# Vivado block design system, xc7z010clg400-1, Vivado 2021.2
# (continued, part 2 of 3)
current_bd_instance /system

# ---- hierarchy /write_to_ram ----
current_bd_instance /write_to_ram
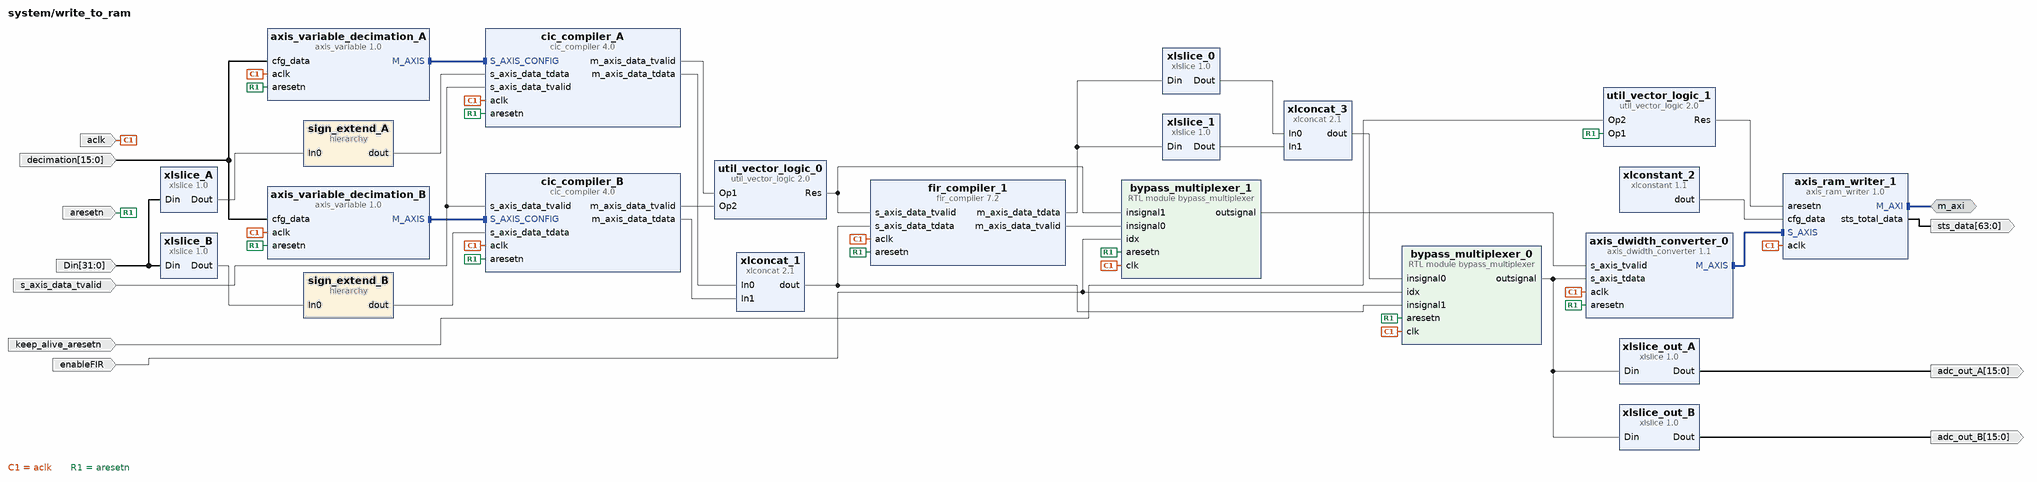
[diagram p12: block diagram inside /write_to_ram]
create_bd_intf_pin -mode Master -vlnv xilinx.com:interface:aximm_rtl:1.0 m_axi
create_bd_pin -dir I -from 31 -to 0 Din
create_bd_pin -dir I -type clk aclk
create_bd_pin -dir O -from 15 -to 0 adc_out_A
create_bd_pin -dir O -from 15 -to 0 adc_out_B
create_bd_pin -dir I -type rst aresetn
create_bd_pin -dir I -from 15 -to 0 decimation
create_bd_pin -dir I enableFIR
create_bd_pin -dir I -type rst keep_alive_aresetn
create_bd_pin -dir I s_axis_data_tvalid
create_bd_pin -dir O -from 63 -to 0 sts_data

create_bd_cell -type ip -vlnv xilinx.com:ip:axis_dwidth_converter:1.1 axis_dwidth_converter_0
set_property -dict {CONFIG.M_TDATA_NUM_BYTES 8 CONFIG.S_TDATA_NUM_BYTES 4} [get_bd_cells axis_dwidth_converter_0]
create_bd_cell -type ip -vlnv pavel-demin:user:axis_ram_writer:1.0 axis_ram_writer_1
set_property -dict {CONFIG.ADDR_WIDTH 24} [get_bd_cells axis_ram_writer_1]
create_bd_cell -type ip -vlnv pavel-demin:user:axis_variable:1.0 axis_variable_decimation_A
set_property -dict {CONFIG.AXIS_TDATA_WIDTH 16} [get_bd_cells axis_variable_decimation_A]
create_bd_cell -type ip -vlnv pavel-demin:user:axis_variable:1.0 axis_variable_decimation_B
set_property -dict {CONFIG.AXIS_TDATA_WIDTH 16} [get_bd_cells axis_variable_decimation_B]
create_bd_cell -type module -reference bypass_multiplexer bypass_multiplexer_0
set_property -dict {CONFIG.DATA_WIDTH 32} [get_bd_cells bypass_multiplexer_0]
create_bd_cell -type module -reference bypass_multiplexer bypass_multiplexer_1
set_property -dict {CONFIG.DATA_WIDTH 1} [get_bd_cells bypass_multiplexer_1]
create_bd_cell -type ip -vlnv xilinx.com:ip:cic_compiler:4.0 cic_compiler_A
set_property -dict [list \
  CONFIG.Clock_Frequency 125 \
  CONFIG.Filter_Type Decimation \
  CONFIG.Fixed_Or_Initial_Rate 8 \
  CONFIG.HAS_ARESETN true \
  CONFIG.Input_Data_Width 14 \
  CONFIG.Input_Sample_Frequency 125 \
  CONFIG.Maximum_Rate 8192 \
  CONFIG.Minimum_Rate 4 \
  CONFIG.Number_Of_Stages 6 \
  CONFIG.Output_Data_Width 16 \
  CONFIG.Quantization Truncation \
  CONFIG.SamplePeriod 1 \
  CONFIG.Sample_Rate_Changes Programmable \
] [get_bd_cells cic_compiler_A]
create_bd_cell -type ip -vlnv xilinx.com:ip:cic_compiler:4.0 cic_compiler_B
set_property -dict [list \
  CONFIG.Clock_Frequency 125 \
  CONFIG.Filter_Type Decimation \
  CONFIG.Fixed_Or_Initial_Rate 8 \
  CONFIG.HAS_ARESETN true \
  CONFIG.Input_Data_Width 14 \
  CONFIG.Input_Sample_Frequency 125 \
  CONFIG.Maximum_Rate 8192 \
  CONFIG.Minimum_Rate 4 \
  CONFIG.Number_Of_Stages 6 \
  CONFIG.Output_Data_Width 16 \
  CONFIG.Quantization Truncation \
  CONFIG.SamplePeriod 1 \
  CONFIG.Sample_Rate_Changes Programmable \
  CONFIG.Use_Xtreme_DSP_Slice true \
] [get_bd_cells cic_compiler_B]
create_bd_cell -type ip -vlnv xilinx.com:ip:fir_compiler:7.2 fir_compiler_1
set_property -dict [list \
  CONFIG.BestPrecision true \
  CONFIG.Clock_Frequency 125 \
  CONFIG.CoefficientVector {9.925103405823654e-6, -4.174363282738153e-5, -5.51901793488376e-5, 7.368959088121815e-5, 0.00015990473687184194, -6.76620396082366e-5, -0.0003346964692496276, -3.9313022473348724e-5, 0.0005560562181887152, 0.0003225578127550501, -0.0007467674417401369, -0.0008420592613214142, 0.0007671235211513573, 0.0016018044027042001, -0.00042717093620696226, -0.0025052594870282234, -0.00047306360426935745, 0.0033218592560732216, 0.002075564973101382, -0.003681857378456846, -0.004378381518006709, 0.0031142208631228657, 0.007150965272845437, -0.0011339320674475808, -0.009875779306823484, -0.0026274562840349655, 0.01174025558643619, 0.008267468617760211, -0.011694071059013518, -0.015463246390667961, 0.008569880890248936, 0.02335524917895585, -0.0012434662137906153, -0.030475702526067405, -0.011215696029381172, 0.03468814181782342, 0.029481462816320546, -0.03299020455574372, -0.05412187304631057, 0.020670791935294395, 0.08620564090140646, 0.012279627206068015, -0.12872548525128363, -0.10014341802122498, 0.18180203856402496, 0.4770892664568863, 0.47708926645688643, 0.18180203856402533, -0.10014341802122484, -0.12872548525128372, 0.012279627206067881, 0.08620564090140649, 0.02067079193529451, -0.05412187304631054, -0.0329902045557438, 0.029481462816320483, 0.03468814181782345, -0.01121569602938112, -0.030475702526067405, -0.0012434662137906513, 0.02335524917895585, 0.008569880890248972, -0.01546324639066795, -0.01169407105901354, 0.008267468617760182, 0.01174025558643619, -0.002627456284034945, -0.009875779306823478, -0.0011339320674475855, 0.007150965272845437, 0.0031142208631228757, -0.004378381518006705, -0.003681857378456855, 0.0020755649731013692, 0.003321859256073219, -0.0004730636042693505, -0.002505259487028216, -0.00042717093620696166, 0.0016018044027042, 0.0007671235211513586, -0.0008420592613214133, -0.0007467674417401388, 0.00032255781275504627, 0.0005560562181887131, -3.931302247334831e-5, -0.000334696469249626, -6.76620396082356e-5, 0.00015990473687184224, 7.368959088121812e-5, -5.519017934883768e-5, -4.174363282738155e-5, 9.925103405823647e-6} \
  CONFIG.Coefficient_Fractional_Bits 24 \
  CONFIG.Coefficient_Sets 1 \
  CONFIG.Coefficient_Sign Signed \
  CONFIG.Coefficient_Structure Symmetric \
  CONFIG.Coefficient_Width 24 \
  CONFIG.ColumnConfig 6 \
  CONFIG.Data_Fractional_Bits 0 \
  CONFIG.Data_Width 16 \
  CONFIG.Decimation_Rate 2 \
  CONFIG.Filter_Architecture Systolic_Multiply_Accumulate \
  CONFIG.Filter_Type Decimation \
  CONFIG.Has_ARESETn true \
  CONFIG.Interpolation_Rate 1 \
  CONFIG.Number_Channels 1 \
  CONFIG.Number_Paths 2 \
  CONFIG.Output_Rounding_Mode Convergent_Rounding_to_Even \
  CONFIG.Output_Width 18 \
  CONFIG.Quantization Quantize_Only \
  CONFIG.RateSpecification Frequency_Specification \
  CONFIG.Rate_Change_Type Integer \
  CONFIG.SamplePeriod 1 \
  CONFIG.Sample_Frequency 31.25 \
  CONFIG.Zero_Pack_Factor 1 \
] [get_bd_cells fir_compiler_1]
create_bd_cell -type hier sign_extend_A
create_bd_cell -type hier sign_extend_B
create_bd_cell -type ip -vlnv xilinx.com:ip:util_vector_logic:2.0 util_vector_logic_0
set_property -dict {CONFIG.C_OPERATION or CONFIG.C_SIZE 1} [get_bd_cells util_vector_logic_0]
create_bd_cell -type ip -vlnv xilinx.com:ip:util_vector_logic:2.0 util_vector_logic_1
set_property -dict {CONFIG.C_OPERATION or} [get_bd_cells util_vector_logic_1]
create_bd_cell -type ip -vlnv xilinx.com:ip:xlconcat:2.1 xlconcat_1
create_bd_cell -type ip -vlnv xilinx.com:ip:xlconcat:2.1 xlconcat_3
create_bd_cell -type ip -vlnv xilinx.com:ip:xlconstant:1.1 xlconstant_2
set_property -dict {CONFIG.CONST_VAL 402653184 CONFIG.CONST_WIDTH 32} [get_bd_cells xlconstant_2]
create_bd_cell -type ip -vlnv xilinx.com:ip:xlslice:1.0 xlslice_0
set_property -dict {CONFIG.DIN_FROM 15 CONFIG.DIN_WIDTH 48 CONFIG.DOUT_WIDTH 16} [get_bd_cells xlslice_0]
create_bd_cell -type ip -vlnv xilinx.com:ip:xlslice:1.0 xlslice_1
set_property -dict {CONFIG.DIN_FROM 39 CONFIG.DIN_TO 24 CONFIG.DIN_WIDTH 48 CONFIG.DOUT_WIDTH 16} [get_bd_cells xlslice_1]
create_bd_cell -type ip -vlnv xilinx.com:ip:xlslice:1.0 xlslice_A
set_property -dict {CONFIG.DIN_FROM 13 CONFIG.DOUT_WIDTH 14} [get_bd_cells xlslice_A]
create_bd_cell -type ip -vlnv xilinx.com:ip:xlslice:1.0 xlslice_B
set_property -dict {CONFIG.DIN_FROM 29 CONFIG.DIN_TO 16 CONFIG.DOUT_WIDTH 14} [get_bd_cells xlslice_B]
create_bd_cell -type ip -vlnv xilinx.com:ip:xlslice:1.0 xlslice_out_A
set_property -dict {CONFIG.DIN_FROM 15 CONFIG.DOUT_WIDTH 16} [get_bd_cells xlslice_out_A]
create_bd_cell -type ip -vlnv xilinx.com:ip:xlslice:1.0 xlslice_out_B
set_property -dict {CONFIG.DIN_FROM 31 CONFIG.DIN_TO 16 CONFIG.DOUT_WIDTH 16} [get_bd_cells xlslice_out_B]

# ---- hierarchy /write_to_ram/sign_extend_A ----
current_bd_instance /write_to_ram/sign_extend_A
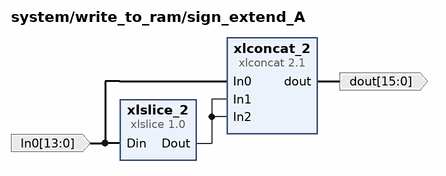
[diagram p13: block diagram inside /write_to_ram/sign_extend_A]
create_bd_pin -dir I -from 13 -to 0 In0
create_bd_pin -dir O -from 15 -to 0 dout

create_bd_cell -type ip -vlnv xilinx.com:ip:xlconcat:2.1 xlconcat_2
set_property -dict {CONFIG.IN0_WIDTH 14 CONFIG.IN1_WIDTH 1 CONFIG.IN2_WIDTH 1 CONFIG.NUM_PORTS 3} [get_bd_cells xlconcat_2]
create_bd_cell -type ip -vlnv xilinx.com:ip:xlslice:1.0 xlslice_2
set_property -dict {CONFIG.DIN_FROM 13 CONFIG.DIN_TO 13 CONFIG.DIN_WIDTH 14 CONFIG.DOUT_WIDTH 1} [get_bd_cells xlslice_2]

# ---- hierarchy /write_to_ram/sign_extend_B ----
current_bd_instance /write_to_ram/sign_extend_B
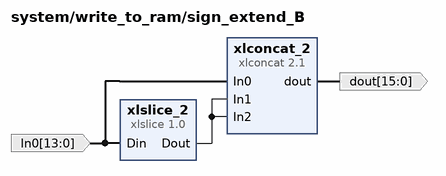
[diagram p14: block diagram inside /write_to_ram/sign_extend_B]
create_bd_pin -dir I -from 13 -to 0 In0
create_bd_pin -dir O -from 15 -to 0 dout

create_bd_cell -type ip -vlnv xilinx.com:ip:xlconcat:2.1 xlconcat_2
set_property -dict {CONFIG.IN0_WIDTH 14 CONFIG.IN1_WIDTH 1 CONFIG.IN2_WIDTH 1 CONFIG.NUM_PORTS 3} [get_bd_cells xlconcat_2]
create_bd_cell -type ip -vlnv xilinx.com:ip:xlslice:1.0 xlslice_2
set_property -dict {CONFIG.DIN_FROM 13 CONFIG.DIN_TO 13 CONFIG.DIN_WIDTH 14 CONFIG.DOUT_WIDTH 1} [get_bd_cells xlslice_2]

# ---- connections ----

current_bd_instance /DIO
connect_bd_net [get_bd_pins ext_DIO6_P] [get_bd_pins rp_iobuf_2/val_tri]
connect_bd_net [get_bd_pins ext_DIO6_N] [get_bd_pins rp_iobuf_3/val_tri]
connect_bd_net [get_bd_pins ext_DIO5_N] [get_bd_pins rp_iobuf_4/val_tri]
connect_bd_net [get_bd_pins ext_DIO4_N] [get_bd_pins rp_iobuf_5/val_tri]
connect_bd_net [get_bd_pins ext_DIO3_N] [get_bd_pins rp_iobuf_6/val_tri]
connect_bd_net [get_bd_pins ext_DIO2_N] [get_bd_pins rp_iobuf_7/val_tri]
connect_bd_net [get_bd_pins ext_DIO7_P] [get_bd_pins rp_iobuf_8/val_tri]
connect_bd_net [get_bd_pins ext_DIO7_N] [get_bd_pins rp_iobuf_9/val_tri]
connect_bd_net [get_bd_pins aresetn] \
  [get_bd_pins hbridgewaveform_0/aresetn] [get_bd_pins hbridgewaveform_1/aresetn] [get_bd_pins util_vector_logic_7/Op1]
connect_bd_net -net c_counter_binary_0_Q [get_bd_pins sequence_stepper_0/step_counter] \
  [get_bd_pins xlslice_35/Din] [get_bd_pins xlslice_36/Din] [get_bd_pins xlslice_37/Din]
connect_bd_net [get_bd_pins cfg_dac] [get_bd_pins xlslice_30/Din] [get_bd_pins xlslice_31/Din]
connect_bd_net -net clk_wiz_0_clk_internal [get_bd_pins clk] \
  [get_bd_pins hbridgewaveform_0/aclk] [get_bd_pins hbridgewaveform_1/aclk] [get_bd_pins rp_iobuf_2/clk] \
  [get_bd_pins rp_iobuf_3/clk] [get_bd_pins rp_iobuf_4/clk] [get_bd_pins rp_iobuf_5/clk] [get_bd_pins rp_iobuf_6/clk] \
  [get_bd_pins rp_iobuf_7/clk] [get_bd_pins rp_iobuf_8/clk] [get_bd_pins rp_iobuf_9/clk] [get_bd_pins sequence_stepper_0/clk]
connect_bd_net [get_bd_pins enable_dac] [get_bd_pins xlslice_18/Din] [get_bd_pins xlslice_32/Din]
connect_bd_net [get_bd_pins hbridgewaveform_0/H1out] [get_bd_pins util_vector_logic_2/Op2]
connect_bd_net [get_bd_pins hbridgewaveform_0/H2out] [get_bd_pins util_vector_logic_3/Op2]
connect_bd_net [get_bd_pins hbridgewaveform_1/H1out] [get_bd_pins util_vector_logic_4/Op2]
connect_bd_net [get_bd_pins hbridgewaveform_1/H2out] [get_bd_pins util_vector_logic_5/Op2]
connect_bd_net [get_bd_pins resync] [get_bd_pins xlslice_22/Din] [get_bd_pins xlslice_29/Din]
connect_bd_net [get_bd_pins rp_iobuf_2/val_in_clocked] [get_bd_pins xlconcat_0/In2]
connect_bd_net [get_bd_pins rp_iobuf_3/val_in_clocked] [get_bd_pins xlconcat_0/In3]
connect_bd_net [get_bd_pins rp_iobuf_4/val_in_clocked] [get_bd_pins xlconcat_0/In4]
connect_bd_net [get_bd_pins rp_iobuf_5/val_in_clocked] [get_bd_pins xlconcat_0/In5]
connect_bd_net [get_bd_pins rp_iobuf_6/val_in_clocked] [get_bd_pins xlconcat_0/In6]
connect_bd_net [get_bd_pins rp_iobuf_7/val_in_clocked] [get_bd_pins xlconcat_0/In7]
connect_bd_net [get_bd_pins rp_iobuf_8/val_in_clocked] [get_bd_pins xlconcat_0/In0]
connect_bd_net [get_bd_pins rp_iobuf_9/val_in_clocked] [get_bd_pins xlconcat_0/In1]
connect_bd_net -net system_cfg_data1 [get_bd_pins cfg_in] \
  [get_bd_pins xlslice_23/Din] [get_bd_pins xlslice_38/Din] [get_bd_pins xlslice_4/Din] [get_bd_pins xlslice_5/Din]
connect_bd_net [get_bd_pins util_reduced_logic_0/Res] [get_bd_pins util_vector_logic_7/Op2]
connect_bd_net [get_bd_pins util_vector_logic_0/Res] [get_bd_pins rp_iobuf_7/val_out]
connect_bd_net [get_bd_pins util_vector_logic_1/Res] [get_bd_pins rp_iobuf_6/val_out]
connect_bd_net [get_bd_pins util_vector_logic_2/Res] [get_bd_pins rp_iobuf_8/val_out]
connect_bd_net [get_bd_pins util_vector_logic_3/Res] [get_bd_pins rp_iobuf_9/val_out]
connect_bd_net [get_bd_pins util_vector_logic_4/Res] [get_bd_pins rp_iobuf_2/val_out]
connect_bd_net [get_bd_pins util_vector_logic_5/Res] [get_bd_pins rp_iobuf_3/val_out]
connect_bd_net [get_bd_pins util_vector_logic_6/Res] [get_bd_pins rp_iobuf_5/val_out]
connect_bd_net [get_bd_pins util_vector_logic_7/Res] [get_bd_pins sequence_stepper_0/aresetn]
connect_bd_net [get_bd_pins xlconcat_0/dout] [get_bd_pins dio_data_clocked]
connect_bd_net [get_bd_pins xlconstant_1/dout] [get_bd_pins xlconcat_0/In8]
connect_bd_net [get_bd_pins xlslice_0/Dout] [get_bd_pins util_vector_logic_2/Op1]
connect_bd_net [get_bd_pins xlslice_10/Dout] [get_bd_pins util_vector_logic_4/Op1]
connect_bd_net [get_bd_pins xlslice_11/Dout] [get_bd_pins util_vector_logic_5/Op1]
connect_bd_net [get_bd_pins xlslice_12/Dout] [get_bd_pins rp_iobuf_4/val_out]
connect_bd_net [get_bd_pins xlslice_13/Dout] [get_bd_pins rp_iobuf_5/direction]
connect_bd_net [get_bd_pins xlslice_14/Dout] [get_bd_pins rp_iobuf_6/direction]
connect_bd_net [get_bd_pins xlslice_15/Dout] [get_bd_pins util_vector_logic_1/Op2]
connect_bd_net [get_bd_pins xlslice_16/Dout] [get_bd_pins util_vector_logic_0/Op2]
connect_bd_net [get_bd_pins xlslice_17/Dout] [get_bd_pins rp_iobuf_7/direction]
connect_bd_net [get_bd_pins xlslice_18/Dout] [get_bd_pins hbridgewaveform_0/enable_All]
connect_bd_net [get_bd_pins xlslice_19/Dout] [get_bd_pins hbridgewaveform_0/freq]
connect_bd_net [get_bd_pins xlslice_1/Dout] [get_bd_pins rp_iobuf_2/direction]
connect_bd_net [get_bd_pins xlslice_20/Dout] [get_bd_pins hbridgewaveform_0/phase]
connect_bd_net [get_bd_pins xlslice_21/Dout] [get_bd_pins hbridgewaveform_0/pulswidth]
connect_bd_net [get_bd_pins xlslice_22/Dout] [get_bd_pins hbridgewaveform_0/resync]
connect_bd_net [get_bd_pins xlslice_23/Dout] \
  [get_bd_pins xlslice_24/Din] [get_bd_pins xlslice_25/Din] [get_bd_pins xlslice_33/Din] [get_bd_pins xlslice_34/Din]
connect_bd_net [get_bd_pins xlslice_24/Dout] [get_bd_pins hbridgewaveform_0/enable_H1]
connect_bd_net [get_bd_pins xlslice_25/Dout] [get_bd_pins hbridgewaveform_0/enable_H2]
connect_bd_net [get_bd_pins xlslice_26/Dout] [get_bd_pins hbridgewaveform_1/freq]
connect_bd_net [get_bd_pins xlslice_27/Dout] [get_bd_pins hbridgewaveform_1/phase]
connect_bd_net [get_bd_pins xlslice_28/Dout] [get_bd_pins hbridgewaveform_1/pulswidth]
connect_bd_net [get_bd_pins xlslice_29/Dout] [get_bd_pins hbridgewaveform_1/resync]
connect_bd_net [get_bd_pins xlslice_2/Dout] [get_bd_pins rp_iobuf_3/direction]
connect_bd_net [get_bd_pins xlslice_30/Dout] [get_bd_pins xlslice_26/Din] [get_bd_pins xlslice_27/Din] [get_bd_pins xlslice_28/Din]
connect_bd_net [get_bd_pins xlslice_31/Dout] [get_bd_pins xlslice_19/Din] [get_bd_pins xlslice_20/Din] [get_bd_pins xlslice_21/Din]
connect_bd_net [get_bd_pins xlslice_32/Dout] [get_bd_pins hbridgewaveform_1/enable_All]
connect_bd_net [get_bd_pins xlslice_33/Dout] [get_bd_pins hbridgewaveform_1/enable_H1]
connect_bd_net [get_bd_pins xlslice_34/Dout] [get_bd_pins hbridgewaveform_1/enable_H2]
connect_bd_net [get_bd_pins xlslice_35/Dout] [get_bd_pins util_vector_logic_0/Op1]
connect_bd_net [get_bd_pins xlslice_36/Dout] [get_bd_pins util_vector_logic_1/Op1]
connect_bd_net [get_bd_pins xlslice_37/Dout] [get_bd_pins util_vector_logic_6/Op1]
connect_bd_net [get_bd_pins xlslice_38/Dout] [get_bd_pins sequence_stepper_0/stepSize] [get_bd_pins util_reduced_logic_0/Op1]
connect_bd_net [get_bd_pins xlslice_3/Dout] [get_bd_pins rp_iobuf_4/direction]
connect_bd_net [get_bd_pins xlslice_4/Dout] \
  [get_bd_pins xlslice_0/Din] [get_bd_pins xlslice_10/Din] [get_bd_pins xlslice_11/Din] [get_bd_pins xlslice_12/Din] \
  [get_bd_pins xlslice_15/Din] [get_bd_pins xlslice_16/Din] [get_bd_pins xlslice_6/Din] [get_bd_pins xlslice_9/Din]
connect_bd_net [get_bd_pins xlslice_5/Dout] \
  [get_bd_pins xlslice_1/Din] [get_bd_pins xlslice_13/Din] [get_bd_pins xlslice_14/Din] [get_bd_pins xlslice_17/Din] \
  [get_bd_pins xlslice_2/Din] [get_bd_pins xlslice_3/Din] [get_bd_pins xlslice_7/Din] [get_bd_pins xlslice_8/Din]
connect_bd_net [get_bd_pins xlslice_6/Dout] [get_bd_pins util_vector_logic_6/Op2]
connect_bd_net [get_bd_pins xlslice_7/Dout] [get_bd_pins rp_iobuf_8/direction]
connect_bd_net [get_bd_pins xlslice_8/Dout] [get_bd_pins rp_iobuf_9/direction]
connect_bd_net [get_bd_pins xlslice_9/Dout] [get_bd_pins util_vector_logic_3/Op1]

current_bd_instance /counter_trigger
connect_bd_net -net adc0_1 [get_bd_pins adc0] [get_bd_pins counter_delayed_trig_0/adc0]
connect_bd_net -net adc1_1 [get_bd_pins adc1] [get_bd_pins counter_delayed_trig_0/adc1]
connect_bd_net [get_bd_pins clk] [get_bd_pins counter_delayed_trig_0/clk]
connect_bd_net [get_bd_pins counter_delayed_trig_0/last_counter] [get_bd_pins xlconcat_1/In0]
connect_bd_net [get_bd_pins counter_delayed_trig_0/trigger] [get_bd_pins counter_trigger] [get_bd_pins xlconcat_0/In3]
connect_bd_net [get_bd_pins counter_delayed_trig_0/trigger_armed] [get_bd_pins xlconcat_0/In4] [get_bd_pins xlconcat_1/In1]
connect_bd_net [get_bd_pins dios] [get_bd_pins counter_delayed_trig_0/dios] [get_bd_pins xlslice_1/Din]
connect_bd_net -net master_trigger_in_1 [get_bd_pins triggerState] [get_bd_pins xlconcat_0/In7]
connect_bd_net -net system_counter_trigger_cfg [get_bd_pins counter_trigger_cfg] \
  [get_bd_pins xlslice_0/Din] [get_bd_pins xlslice_10/Din] [get_bd_pins xlslice_2/Din] [get_bd_pins xlslice_7/Din] \
  [get_bd_pins xlslice_8/Din] [get_bd_pins xlslice_9/Din]
connect_bd_net [get_bd_pins xlconcat_0/dout] [get_bd_pins LED]
connect_bd_net [get_bd_pins xlconcat_1/dout] [get_bd_pins counter_trigger_sts]
connect_bd_net [get_bd_pins xlconstant_2/dout] [get_bd_pins xlconcat_1/In2]
connect_bd_net [get_bd_pins xlslice_0/Dout] [get_bd_pins counter_delayed_trig_0/trigger_reset] [get_bd_pins xlconcat_0/In2]
connect_bd_net [get_bd_pins xlslice_10/Dout] [get_bd_pins counter_delayed_trig_0/enable] [get_bd_pins xlconcat_0/In0]
connect_bd_net [get_bd_pins xlslice_1/Dout] [get_bd_pins xlconcat_0/In5]
connect_bd_net [get_bd_pins xlslice_2/Dout] [get_bd_pins counter_delayed_trig_0/source_select] [get_bd_pins xlslice_3/Din]
connect_bd_net [get_bd_pins xlslice_3/Dout] [get_bd_pins xlconcat_0/In6]
connect_bd_net [get_bd_pins xlslice_7/Dout] [get_bd_pins counter_delayed_trig_0/reference_counter]
connect_bd_net [get_bd_pins xlslice_8/Dout] [get_bd_pins counter_delayed_trig_0/trigger_presamples]
connect_bd_net [get_bd_pins xlslice_9/Dout] [get_bd_pins counter_delayed_trig_0/trigger_arm] [get_bd_pins xlconcat_0/In1]

current_bd_instance /fourier_synth_standard
connect_bd_intf_net [get_bd_intf_pins awg_0_bram] [get_bd_intf_pins signal_compose/awg_bram]
connect_bd_intf_net [get_bd_intf_pins awg_1_bram] [get_bd_intf_pins signal_compose1/awg_bram]
connect_bd_net -net Din_1_1 [get_bd_pins xlslice_2/Dout] [get_bd_pins signal_compose1/offset]
connect_bd_net [get_bd_pins aclk] [get_bd_pins signal_compose/aclk] [get_bd_pins signal_compose1/aclk]
connect_bd_net -net aresetn_1 [get_bd_pins xlslice_8/Dout] [get_bd_pins signal_compose1/aresetn]
connect_bd_net [get_bd_pins aresetn] [get_bd_pins xlslice_8/Din] [get_bd_pins xlslice_9/Din]
connect_bd_net -net aresetn_3 [get_bd_pins xlslice_9/Dout] [get_bd_pins signal_compose/aresetn]
connect_bd_net [get_bd_pins bram_aresetn] [get_bd_pins signal_compose/bram_aresetn] [get_bd_pins signal_compose1/bram_aresetn]
connect_bd_net [get_bd_pins cfg_data] [get_bd_pins xlslice_0/Din] [get_bd_pins xlslice_1/Din]
connect_bd_net [get_bd_pins enable_dac] [get_bd_pins util_vector_logic_2/Op1]
connect_bd_net [get_bd_pins enable_ramping] [get_bd_pins enable_ramping_slice_0/enable_ramping]
connect_bd_net [get_bd_pins enable_ramping_slice_0/enable_ramping_0] [get_bd_pins signal_compose/enable_ramping]
connect_bd_net [get_bd_pins enable_ramping_slice_0/enable_ramping_1] [get_bd_pins signal_compose1/enable_ramping]
connect_bd_net [get_bd_pins enable_ramping_slice_0/start_ramp_down_0] [get_bd_pins signal_compose/start_ramp_down]
connect_bd_net [get_bd_pins enable_ramping_slice_0/start_ramp_down_1] [get_bd_pins signal_compose1/start_ramp_down]
connect_bd_net [get_bd_pins oa_dac] [get_bd_pins xlslice_2/Din] [get_bd_pins xlslice_3/Din]
connect_bd_net [get_bd_pins resync_dac] [get_bd_pins xlslice_6/Din] [get_bd_pins xlslice_7/Din]
connect_bd_net [get_bd_pins seq_ramp_down] [get_bd_pins enable_ramping_slice_0/seq_ramp_down]
connect_bd_net [get_bd_pins signal_compose1/S] [get_bd_pins xlconcat_2/In1]
connect_bd_net [get_bd_pins signal_compose1/m_axis_data_tvalid_1] [get_bd_pins util_vector_logic_1/Op2]
connect_bd_net [get_bd_pins signal_compose1/ramp_state_1] [get_bd_pins ramp_state_1]
connect_bd_net [get_bd_pins signal_compose/S] [get_bd_pins xlconcat_2/In0]
connect_bd_net [get_bd_pins signal_compose/ramp_state_0] [get_bd_pins ramp_state_0]
connect_bd_net -net signal_gen_m_axis_data_tvalid_1 [get_bd_pins signal_compose/m_axis_data_tvalid_1] [get_bd_pins util_vector_logic_1/Op1]
connect_bd_net [get_bd_pins start_ramp_down] [get_bd_pins enable_ramping_slice_0/start_ramp_down]
connect_bd_net [get_bd_pins util_vector_logic_1/Res] [get_bd_pins synth_tvalid]
connect_bd_net [get_bd_pins util_vector_logic_2/Res] [get_bd_pins xlslice_4/Din] [get_bd_pins xlslice_5/Din]
connect_bd_net [get_bd_pins xlconcat_2/dout] [get_bd_pins synth_tdata]
connect_bd_net [get_bd_pins xlslice_0/Dout] [get_bd_pins signal_compose/Din]
connect_bd_net [get_bd_pins xlslice_1/Dout] [get_bd_pins signal_compose1/Din]
connect_bd_net [get_bd_pins xlslice_3/Dout] [get_bd_pins signal_compose/offset]
connect_bd_net [get_bd_pins xlslice_4/Dout] [get_bd_pins signal_compose/disable_dac]
connect_bd_net [get_bd_pins xlslice_5/Dout] [get_bd_pins signal_compose1/disable_dac]
connect_bd_net [get_bd_pins xlslice_6/Dout] [get_bd_pins signal_compose/resync_dac]
connect_bd_net [get_bd_pins xlslice_7/Dout] [get_bd_pins signal_compose1/resync_dac]

current_bd_instance /fourier_synth_standard/signal_compose
connect_bd_intf_net [get_bd_intf_pins awg_bram] [get_bd_intf_pins waveform_awg/S_AXI]
connect_bd_net [get_bd_pins Din] [get_bd_pins signal_cfg_slice_0/cfg_data]
connect_bd_net [get_bd_pins aclk] \
  [get_bd_pins signal_calib_0/aclk] [get_bd_pins signal_composer_0/clk] [get_bd_pins signal_ramp/aclk] \
  [get_bd_pins waveform_awg/aclk] [get_bd_pins new_waveform_gen_0/aclk_0] [get_bd_pins new_waveform_gen_1/aclk_0]
connect_bd_net -net amplitude_1 [get_bd_pins signal_cfg_slice_0/comp_1_amp] [get_bd_pins new_waveform_gen_1/amplitude]
connect_bd_net [get_bd_pins aresetn] \
  [get_bd_pins signal_ramp/aresetn] [get_bd_pins waveform_awg/aresetn] [get_bd_pins new_waveform_gen_0/aresetn] \
  [get_bd_pins new_waveform_gen_1/resync] [get_bd_pins new_waveform_gen_1/aresetn]
connect_bd_net [get_bd_pins bram_aresetn] [get_bd_pins waveform_awg/bram_aresetn]
connect_bd_net [get_bd_pins disable_dac] [get_bd_pins signal_composer_0/disable_dac]
connect_bd_net -net freq_1 [get_bd_pins signal_cfg_slice_0/comp_1_freq] [get_bd_pins new_waveform_gen_1/freq]
connect_bd_net [get_bd_pins new_waveform_gen_0/M_AXIS_DOUT_0_tdata] [get_bd_pins signal_composer_0/wave0]
connect_bd_net [get_bd_pins new_waveform_gen_0/M_AXIS_DOUT_0_tvalid] [get_bd_pins signal_composer_0/valid0]
connect_bd_net [get_bd_pins new_waveform_gen_1/M_AXIS_DOUT_0_tdata] [get_bd_pins signal_composer_0/wave1]
connect_bd_net [get_bd_pins new_waveform_gen_1/M_AXIS_DOUT_0_tvalid] [get_bd_pins signal_composer_0/valid1]
connect_bd_net [get_bd_pins offset] [get_bd_pins signal_composer_0/seq]
connect_bd_net -net phase_1 [get_bd_pins signal_cfg_slice_0/comp_1_phase] [get_bd_pins new_waveform_gen_1/phase]
connect_bd_net -net ramping_enable_1 [get_bd_pins enable_ramping] [get_bd_pins signal_ramp/enableRamping]
connect_bd_net [get_bd_pins resync_dac] [get_bd_pins new_waveform_gen_0/resync]
connect_bd_net [get_bd_pins signal_calib_0/signal_out] [get_bd_pins S]
connect_bd_net [get_bd_pins signal_cfg_slice_0/calib_limit_lower] [get_bd_pins signal_calib_0/limit_lower]
connect_bd_net [get_bd_pins signal_cfg_slice_0/calib_limit_upper] [get_bd_pins signal_calib_0/limit_upper]
connect_bd_net [get_bd_pins signal_cfg_slice_0/calib_offset] [get_bd_pins signal_calib_0/calib_offset]
# net signal_cfg_slice_0_calib_scale has one end: signal_cfg_slice_0/calib_scale
connect_bd_net [get_bd_pins signal_cfg_slice_0/comp_0_amp] [get_bd_pins new_waveform_gen_0/amplitude]
connect_bd_net [get_bd_pins signal_cfg_slice_0/comp_0_freq] [get_bd_pins new_waveform_gen_0/freq]
connect_bd_net [get_bd_pins signal_cfg_slice_0/comp_0_phase] [get_bd_pins new_waveform_gen_0/phase]
connect_bd_net [get_bd_pins signal_cfg_slice_0/comp_3_freq] [get_bd_pins waveform_awg/freq]
connect_bd_net [get_bd_pins signal_cfg_slice_0/comp_3_phase] [get_bd_pins waveform_awg/phase]
connect_bd_net [get_bd_pins signal_cfg_slice_0/offset] [get_bd_pins signal_composer_0/offset]
connect_bd_net [get_bd_pins signal_cfg_slice_0/ramp_freq] [get_bd_pins signal_ramp/freq]
connect_bd_net [get_bd_pins signal_composer_0/signal_out] [get_bd_pins signal_ramp/signal_in]
connect_bd_net [get_bd_pins signal_composer_0/signal_valid] [get_bd_pins m_axis_data_tvalid_1]
connect_bd_net [get_bd_pins signal_ramp/ramp_state] [get_bd_pins ramp_state_0]
connect_bd_net [get_bd_pins signal_ramp/signal_out] [get_bd_pins signal_calib_0/signal_in]
connect_bd_net [get_bd_pins start_ramp_down] [get_bd_pins signal_ramp/startRampDown]
connect_bd_net [get_bd_pins waveform_awg/S] [get_bd_pins signal_composer_0/wave3]
connect_bd_net [get_bd_pins xlconstant_0/dout] [get_bd_pins signal_composer_0/valid3]

current_bd_instance /fourier_synth_standard/signal_compose/waveform_awg
connect_bd_intf_net [get_bd_intf_pins S_AXI] [get_bd_intf_pins axi_bram_ctrl_0/S_AXI]
connect_bd_intf_net [get_bd_intf_pins axi_bram_ctrl_0/BRAM_PORTA] [get_bd_intf_pins blk_mem_gen_0/BRAM_PORTA]
connect_bd_intf_net [get_bd_intf_pins axis_variable_0/M_AXIS] [get_bd_intf_pins dds_compiler_0/S_AXIS_CONFIG]
connect_bd_net [get_bd_pins aclk] \
  [get_bd_pins axi_bram_ctrl_0/s_axi_aclk] [get_bd_pins axis_variable_0/aclk] [get_bd_pins blk_mem_gen_0/clkb] \
  [get_bd_pins dds_compiler_0/aclk] [get_bd_pins wave_awg_composer_0/aclk]
connect_bd_net [get_bd_pins aresetn] \
  [get_bd_pins axis_variable_0/aresetn] [get_bd_pins dds_compiler_0/aresetn] [get_bd_pins wave_awg_composer_0/aresetn]
connect_bd_net [get_bd_pins blk_mem_gen_0/doutb] [get_bd_pins wave_awg_composer_0/wave_in]
connect_bd_net [get_bd_pins bram_aresetn] [get_bd_pins axi_bram_ctrl_0/s_axi_aresetn]
connect_bd_net [get_bd_pins dds_compiler_0/m_axis_phase_tdata] [get_bd_pins element_slice/Din] [get_bd_pins odd_slice/Din]
connect_bd_net [get_bd_pins element_slice/Dout] [get_bd_pins to_32_bit_address/In1]
connect_bd_net [get_bd_pins freq] [get_bd_pins xlconcat_0/In0]
connect_bd_net [get_bd_pins odd_slice/Dout] [get_bd_pins wave_awg_composer_0/odd]
connect_bd_net [get_bd_pins phase] [get_bd_pins xlconcat_0/In1]
connect_bd_net [get_bd_pins wave_awg_composer_0/wave_out] [get_bd_pins S]
connect_bd_net [get_bd_pins xlconcat_0/dout] [get_bd_pins axis_variable_0/cfg_data]
connect_bd_net -net xlconcat_1_dout [get_bd_pins to_32_bit_address/dout] [get_bd_pins blk_mem_gen_0/addrb]
connect_bd_net -net xlconstant_0_dout [get_bd_pins enable_read_constant/dout] [get_bd_pins blk_mem_gen_0/enb]
connect_bd_net [get_bd_pins xlconstant_0/dout] [get_bd_pins to_32_bit_address/In2]
connect_bd_net [get_bd_pins xlconstant_1/dout] [get_bd_pins to_32_bit_address/In0]
set_property HDL_ATTRIBUTE.BMM_INFO_ADDRESS_SPACE {byte  0x80020000 32 > system fourier_synth_standard/signal_compose/waveform_awg/blk_mem_gen_0} [get_bd_cells axi_bram_ctrl_0]
set_property HDL_ATTRIBUTE.KEEP_HIERARCHY yes [get_bd_cells axi_bram_ctrl_0]

current_bd_instance /fourier_synth_standard/signal_compose1
connect_bd_intf_net [get_bd_intf_pins awg_bram] [get_bd_intf_pins waveform_awg1/S_AXI]
connect_bd_net [get_bd_pins Din] [get_bd_pins signal_cfg_slice_0/cfg_data]
connect_bd_net -net amplitude_1 [get_bd_pins signal_cfg_slice_0/comp_0_amp] [get_bd_pins waveform_gen_0/amplitude]
connect_bd_net -net amplitude_2 [get_bd_pins signal_cfg_slice_0/comp_1_amp] [get_bd_pins waveform_gen_1/amplitude]
connect_bd_net -net amplitude_3 [get_bd_pins signal_cfg_slice_0/comp_2_amp] [get_bd_pins waveform_gen_2/amplitude]
connect_bd_net [get_bd_pins bram_aresetn] [get_bd_pins waveform_awg1/bram_aresetn]
connect_bd_net -net cfg_data_1 [get_bd_pins signal_cfg_slice_0/comp_1_cfg] [get_bd_pins waveform_gen_0/cfg_data]
connect_bd_net -net cfg_data_2 [get_bd_pins signal_cfg_slice_0/comp_2_cfg] [get_bd_pins waveform_gen_1/cfg_data]
connect_bd_net -net cfg_data_3 [get_bd_pins signal_cfg_slice_0/comp_3_cfg] [get_bd_pins waveform_gen_2/cfg_data]
connect_bd_net -net clk_wiz_0_clk_internal [get_bd_pins aclk] \
  [get_bd_pins signal_calib_0/aclk] [get_bd_pins signal_composer_0/clk] [get_bd_pins signal_ramp_0/aclk] \
  [get_bd_pins waveform_awg1/aclk] [get_bd_pins waveform_gen_0/aclk] [get_bd_pins waveform_gen_1/aclk] \
  [get_bd_pins waveform_gen_2/aclk]
connect_bd_net [get_bd_pins disable_dac] [get_bd_pins signal_composer_0/disable_dac]
connect_bd_net [get_bd_pins enable_ramping] [get_bd_pins signal_ramp_0/enableRamping]
connect_bd_net -net freq_1 [get_bd_pins signal_cfg_slice_0/comp_0_freq] [get_bd_pins waveform_gen_0/freq]
connect_bd_net -net freq_2 [get_bd_pins signal_cfg_slice_0/comp_1_freq] [get_bd_pins waveform_gen_1/freq]
connect_bd_net -net freq_3 [get_bd_pins signal_cfg_slice_0/comp_2_freq] [get_bd_pins waveform_gen_2/freq]
connect_bd_net [get_bd_pins offset] [get_bd_pins signal_composer_0/seq]
connect_bd_net -net phase_1 [get_bd_pins signal_cfg_slice_0/comp_0_phase] [get_bd_pins waveform_gen_0/phase]
connect_bd_net -net phase_2 [get_bd_pins signal_cfg_slice_0/comp_1_phase] [get_bd_pins waveform_gen_1/phase]
connect_bd_net -net phase_3 [get_bd_pins signal_cfg_slice_0/comp_2_phase] [get_bd_pins waveform_gen_2/phase]
connect_bd_net [get_bd_pins resync_dac] [get_bd_pins waveform_gen_0/resync] [get_bd_pins waveform_gen_1/resync] [get_bd_pins waveform_gen_2/resync]
connect_bd_net -net rst_ps7_0_125M_peripheral_aresetn [get_bd_pins aresetn] \
  [get_bd_pins signal_ramp_0/aresetn] [get_bd_pins waveform_awg1/aresetn] [get_bd_pins waveform_gen_0/aresetn] \
  [get_bd_pins waveform_gen_1/aresetn] [get_bd_pins waveform_gen_2/aresetn]
connect_bd_net [get_bd_pins signal_calib_0/signal_out] [get_bd_pins S]
connect_bd_net [get_bd_pins signal_cfg_slice_0/calib_limit_lower] [get_bd_pins signal_calib_0/limit_lower]
connect_bd_net [get_bd_pins signal_cfg_slice_0/calib_limit_upper] [get_bd_pins signal_calib_0/limit_upper]
connect_bd_net [get_bd_pins signal_cfg_slice_0/calib_offset] [get_bd_pins signal_calib_0/calib_offset]
# net signal_cfg_slice_0_calib_scale has one end: signal_cfg_slice_0/calib_scale
connect_bd_net [get_bd_pins signal_cfg_slice_0/comp_3_freq] [get_bd_pins waveform_awg1/freq]
connect_bd_net [get_bd_pins signal_cfg_slice_0/comp_3_phase] [get_bd_pins waveform_awg1/phase]
connect_bd_net [get_bd_pins signal_cfg_slice_0/offset] [get_bd_pins signal_composer_0/offset]
connect_bd_net [get_bd_pins signal_cfg_slice_0/ramp_freq] [get_bd_pins signal_ramp_0/freq]
connect_bd_net [get_bd_pins signal_composer_0/signal_out] [get_bd_pins signal_ramp_0/signal_in]
connect_bd_net [get_bd_pins signal_composer_0/signal_valid] [get_bd_pins m_axis_data_tvalid_1]
connect_bd_net [get_bd_pins signal_ramp_0/ramp_state] [get_bd_pins ramp_state_1]
connect_bd_net [get_bd_pins signal_ramp_0/signal_out] [get_bd_pins signal_calib_0/signal_in]
connect_bd_net [get_bd_pins start_ramp_down] [get_bd_pins signal_ramp_0/startRampDown]
connect_bd_net [get_bd_pins waveform_awg1/S] [get_bd_pins signal_composer_0/wave3]
connect_bd_net [get_bd_pins waveform_gen_0/m_axis_data_tvalid_1] [get_bd_pins signal_composer_0/valid0]
connect_bd_net [get_bd_pins waveform_gen_0/wave] [get_bd_pins signal_composer_0/wave0]
connect_bd_net [get_bd_pins waveform_gen_1/m_axis_data_tvalid_1] [get_bd_pins signal_composer_0/valid1]
connect_bd_net [get_bd_pins waveform_gen_1/wave] [get_bd_pins signal_composer_0/wave1]
connect_bd_net [get_bd_pins waveform_gen_2/m_axis_data_tvalid_1] [get_bd_pins signal_composer_0/valid2]
connect_bd_net [get_bd_pins waveform_gen_2/wave] [get_bd_pins signal_composer_0/wave2]
connect_bd_net [get_bd_pins xlconstant_0/dout] [get_bd_pins signal_composer_0/valid3]

current_bd_instance /fourier_synth_standard/signal_compose1/waveform_awg1
connect_bd_intf_net [get_bd_intf_pins S_AXI] [get_bd_intf_pins axi_bram_ctrl_0/S_AXI]
connect_bd_intf_net [get_bd_intf_pins axi_bram_ctrl_0/BRAM_PORTA] [get_bd_intf_pins blk_mem_gen_0/BRAM_PORTA]
connect_bd_intf_net [get_bd_intf_pins axis_variable_0/M_AXIS] [get_bd_intf_pins dds_compiler_0/S_AXIS_CONFIG]
connect_bd_net [get_bd_pins aresetn] \
  [get_bd_pins axis_variable_0/aresetn] [get_bd_pins dds_compiler_0/aresetn] [get_bd_pins wave_awg_composer_0/aresetn]
connect_bd_net [get_bd_pins blk_mem_gen_0/doutb] [get_bd_pins wave_awg_composer_0/wave_in]
connect_bd_net [get_bd_pins bram_aresetn] [get_bd_pins axi_bram_ctrl_0/s_axi_aresetn]
connect_bd_net -net clk_wiz_0_clk_internal [get_bd_pins aclk] \
  [get_bd_pins axi_bram_ctrl_0/s_axi_aclk] [get_bd_pins axis_variable_0/aclk] [get_bd_pins blk_mem_gen_0/clkb] \
  [get_bd_pins dds_compiler_0/aclk] [get_bd_pins wave_awg_composer_0/aclk]
connect_bd_net [get_bd_pins dds_compiler_0/m_axis_phase_tdata] [get_bd_pins element_slice/Din] [get_bd_pins odd_slice/Din]
connect_bd_net [get_bd_pins element_slice/Dout] [get_bd_pins to_32_bit_address/In1]
connect_bd_net [get_bd_pins enable_read_constant/dout] [get_bd_pins blk_mem_gen_0/enb]
connect_bd_net [get_bd_pins freq] [get_bd_pins xlconcat_0/In0]
connect_bd_net [get_bd_pins odd_slice/Dout] [get_bd_pins wave_awg_composer_0/odd]
connect_bd_net [get_bd_pins phase] [get_bd_pins xlconcat_0/In1]
connect_bd_net [get_bd_pins wave_awg_composer_0/wave_out] [get_bd_pins S]
connect_bd_net [get_bd_pins xlconcat_0/dout] [get_bd_pins axis_variable_0/cfg_data]
connect_bd_net -net xlconcat_1_dout [get_bd_pins to_32_bit_address/dout] [get_bd_pins blk_mem_gen_0/addrb]
connect_bd_net [get_bd_pins xlconstant_0/dout] [get_bd_pins to_32_bit_address/In2]
connect_bd_net [get_bd_pins xlconstant_1/dout] [get_bd_pins to_32_bit_address/In0]
set_property HDL_ATTRIBUTE.BMM_INFO_ADDRESS_SPACE {byte  0x80028000 32 > system fourier_synth_standard/signal_compose1/waveform_awg1/blk_mem_gen_0} [get_bd_cells axi_bram_ctrl_0]
set_property HDL_ATTRIBUTE.KEEP_HIERARCHY yes [get_bd_cells axi_bram_ctrl_0]

current_bd_instance /sequencer
connect_bd_intf_net [get_bd_intf_pins axi_bram_ctrl_0/BRAM_PORTA] [get_bd_intf_pins blk_mem_gen_0/BRAM_PORTA]
connect_bd_intf_net [get_bd_intf_pins seq_bram] [get_bd_intf_pins axi_bram_ctrl_0/S_AXI]
connect_bd_net [get_bd_pins aclk] \
  [get_bd_pins axi_bram_ctrl_0/s_axi_aclk] [get_bd_pins blk_mem_gen_0/clkb] [get_bd_pins sequence_slice_0/clk] \
  [get_bd_pins sequence_stepper_0/clk]
connect_bd_net -net aresetn3_1 [get_bd_pins keep_alive_aresetn] [get_bd_pins util_vector_logic_0/Op2]
connect_bd_net [get_bd_pins blk_mem_gen_0/doutb] [get_bd_pins sequence_slice_0/seq_data]
connect_bd_net [get_bd_pins bram_aresetn] [get_bd_pins axi_bram_ctrl_0/s_axi_aresetn]
connect_bd_net [get_bd_pins bram_element_slice/Dout] [get_bd_pins concat_element_addr/In1]
connect_bd_net [get_bd_pins cfg_data] [get_bd_pins sequence_stepper_0/stepSize]
connect_bd_net [get_bd_pins concat_element_addr/dout] [get_bd_pins blk_mem_gen_0/addrb]
connect_bd_net [get_bd_pins ddr_clk] [get_bd_pins pdm_1/clk] [get_bd_pins pdm_2/clk] [get_bd_pins pdm_3/clk] [get_bd_pins pdm_4/clk]
connect_bd_net [get_bd_pins output_on] [get_bd_pins util_vector_logic_8/Op1]
connect_bd_net [get_bd_pins pdm_1/dout] [get_bd_pins xlconcat_0/In0]
connect_bd_net [get_bd_pins pdm_2/dout] [get_bd_pins xlconcat_0/In1]
connect_bd_net [get_bd_pins pdm_3/dout] [get_bd_pins xlconcat_0/In2]
connect_bd_net [get_bd_pins pdm_4/dout] [get_bd_pins xlconcat_0/In3]
connect_bd_net -net rst_ps7_0_125M_peripheral_aresetn [get_bd_pins aresetn] \
  [get_bd_pins pdm_1/aresetn] [get_bd_pins pdm_2/aresetn] [get_bd_pins pdm_3/aresetn] [get_bd_pins pdm_4/aresetn] \
  [get_bd_pins sequence_slice_0/aresetn] [get_bd_pins sequence_stepper_0/aresetn] [get_bd_pins util_vector_logic_0/Op1]
connect_bd_net [get_bd_pins sequence_slice_0/dac_value_0] [get_bd_pins xlconcat_1/In0]
connect_bd_net [get_bd_pins sequence_slice_0/dac_value_1] [get_bd_pins xlconcat_1/In1]
connect_bd_net [get_bd_pins sequence_slice_0/enable_dac] [get_bd_pins enable_dac]
connect_bd_net [get_bd_pins sequence_slice_0/enable_dac_ramp_down] [get_bd_pins seq_ramp_down]
connect_bd_net [get_bd_pins sequence_slice_0/enable_pdm] [get_bd_pins util_vector_logic_8/Op2]
connect_bd_net [get_bd_pins sequence_slice_0/pdm_value_0] [get_bd_pins pdm_1/din]
connect_bd_net [get_bd_pins sequence_slice_0/pdm_value_1] [get_bd_pins pdm_2/din]
connect_bd_net [get_bd_pins sequence_slice_0/pdm_value_2] [get_bd_pins pdm_3/din]
connect_bd_net [get_bd_pins sequence_slice_0/pdm_value_3] [get_bd_pins pdm_4/din]
connect_bd_net [get_bd_pins sequence_slice_0/resync_dac] [get_bd_pins resync_dac]
connect_bd_net [get_bd_pins util_vector_logic_7/Res] [get_bd_pins dout]
connect_bd_net [get_bd_pins util_vector_logic_8/Res] [get_bd_pins util_vector_logic_7/Op2]
connect_bd_net [get_bd_pins xlconcat_0/dout] [get_bd_pins util_vector_logic_7/Op1]
connect_bd_net [get_bd_pins xlconcat_1/dout] [get_bd_pins oa_dac]
connect_bd_net [get_bd_pins xlconstant_0/dout] [get_bd_pins blk_mem_gen_0/enb]
connect_bd_net -net xlslice_1_Dout [get_bd_pins sequence_stepper_0/step_counter] [get_bd_pins pdm_sts] [get_bd_pins bram_element_slice/Din]
connect_bd_net [get_bd_pins zero_constant1/dout] [get_bd_pins concat_element_addr/In0]
connect_bd_net [get_bd_pins zero_constant/dout] [get_bd_pins concat_element_addr/In2]
set_property HDL_ATTRIBUTE.BMM_INFO_ADDRESS_SPACE {byte  0x80000000 128 > system sequencer/blk_mem_gen_0} [get_bd_cells axi_bram_ctrl_0]
set_property HDL_ATTRIBUTE.KEEP_HIERARCHY yes [get_bd_cells axi_bram_ctrl_0]

current_bd_instance /system
connect_bd_intf_net [get_bd_intf_pins M02_AXI] [get_bd_intf_pins axi_interconnect_0/M02_AXI]
connect_bd_intf_net [get_bd_intf_pins axi_cfg_register_dac/S_AXI] [get_bd_intf_pins axi_interconnect_0/M00_AXI]
connect_bd_intf_net [get_bd_intf_pins axi_interconnect_0/M01_AXI] [get_bd_intf_pins axi_sts_register_adc/S_AXI]
connect_bd_intf_net [get_bd_intf_pins axi_interconnect_0/M03_AXI] [get_bd_intf_pins axi_sts_register_DIOIn/S_AXI]
connect_bd_intf_net [get_bd_intf_pins axi_interconnect_0/M04_AXI] [get_bd_intf_pins axi_sts_register_pdm/S_AXI]
connect_bd_intf_net [get_bd_intf_pins axi_cfg_register_cfg/S_AXI] [get_bd_intf_pins axi_interconnect_0/M05_AXI]
connect_bd_intf_net [get_bd_intf_pins axi_interconnect_0/M06_AXI] [get_bd_intf_pins axi_sts_register_reset/S_AXI]
connect_bd_intf_net [get_bd_intf_pins axi_interconnect_0/M07_AXI] [get_bd_intf_pins axi_sts_register_counter_trigger/S_AXI]
connect_bd_intf_net [get_bd_intf_pins axi_cfg_register_counter_trigger/S_AXI] [get_bd_intf_pins axi_interconnect_0/M08_AXI]
connect_bd_intf_net [get_bd_intf_pins axi_interconnect_0/M09_AXI] [get_bd_intf_pins axi_sts_register_image_version/S_AXI]
connect_bd_intf_net [get_bd_intf_pins seq_bram] [get_bd_intf_pins axi_interconnect_1/M00_AXI]
connect_bd_intf_net [get_bd_intf_pins awg_0_bram] [get_bd_intf_pins axi_interconnect_1/M01_AXI]
connect_bd_intf_net [get_bd_intf_pins awg_1_bram] [get_bd_intf_pins axi_interconnect_1/M02_AXI]
connect_bd_intf_net [get_bd_intf_pins S_AXI_HP0] [get_bd_intf_pins processing_system7_0/S_AXI_HP0]
connect_bd_intf_net [get_bd_intf_pins DDR] [get_bd_intf_pins processing_system7_0/DDR]
connect_bd_intf_net [get_bd_intf_pins FIXED_IO] [get_bd_intf_pins processing_system7_0/FIXED_IO]
connect_bd_intf_net [get_bd_intf_pins axi_interconnect_0/S00_AXI] [get_bd_intf_pins processing_system7_0/M_AXI_GP0]
connect_bd_intf_net [get_bd_intf_pins axi_interconnect_1/S00_AXI] [get_bd_intf_pins processing_system7_0/M_AXI_GP1]
connect_bd_net -net axi_cfg_register_1_cfg_data1 [get_bd_pins axi_cfg_register_dac/cfg_data] [get_bd_pins dac_cfg]
connect_bd_net -net axi_cfg_register_1_cfg_data2 [get_bd_pins axi_cfg_register_cfg/cfg_data] [get_bd_pins cfg_data]
connect_bd_net -net axi_cfg_register_axi_sts_register_counter_trigger_cfg_data [get_bd_pins axi_cfg_register_counter_trigger/cfg_data] \
  [get_bd_pins counter_trigger_cfg]
connect_bd_net -net clk_wiz_0_clk_internal [get_bd_pins S_AXI_HP0_ACLK] \
  [get_bd_pins axi_cfg_register_cfg/aclk] [get_bd_pins axi_cfg_register_counter_trigger/aclk] \
  [get_bd_pins axi_cfg_register_dac/aclk] [get_bd_pins axi_interconnect_0/ACLK] [get_bd_pins axi_interconnect_0/M00_ACLK] \
  [get_bd_pins axi_interconnect_0/M01_ACLK] [get_bd_pins axi_interconnect_0/M02_ACLK] \
  [get_bd_pins axi_interconnect_0/M03_ACLK] [get_bd_pins axi_interconnect_0/M04_ACLK] \
  [get_bd_pins axi_interconnect_0/M05_ACLK] [get_bd_pins axi_interconnect_0/M06_ACLK] \
  [get_bd_pins axi_interconnect_0/M07_ACLK] [get_bd_pins axi_interconnect_0/M08_ACLK] \
  [get_bd_pins axi_interconnect_0/M09_ACLK] [get_bd_pins axi_interconnect_0/S00_ACLK] [get_bd_pins axi_interconnect_1/ACLK] \
  [get_bd_pins axi_interconnect_1/M00_ACLK] [get_bd_pins axi_interconnect_1/M01_ACLK] \
  [get_bd_pins axi_interconnect_1/M02_ACLK] [get_bd_pins axi_interconnect_1/S00_ACLK] \
  [get_bd_pins axi_sts_register_DIOIn/aclk] [get_bd_pins axi_sts_register_adc/aclk] \
  [get_bd_pins axi_sts_register_counter_trigger/aclk] [get_bd_pins axi_sts_register_image_version/aclk] \
  [get_bd_pins axi_sts_register_pdm/aclk] [get_bd_pins axi_sts_register_reset/aclk] \
  [get_bd_pins processing_system7_0/M_AXI_GP0_ACLK] [get_bd_pins processing_system7_0/M_AXI_GP1_ACLK] \
  [get_bd_pins processing_system7_0/S_AXI_HP0_ACLK] [get_bd_pins rst_ps7_0_125M/slowest_sync_clk]
connect_bd_net -net clk_wiz_0_locked [get_bd_pins dcm_locked] [get_bd_pins rst_ps7_0_125M/dcm_locked]
connect_bd_net [get_bd_pins image_version/dout] [get_bd_pins axi_sts_register_image_version/sts_data]
connect_bd_net [get_bd_pins processing_system7_0/FCLK_CLK0] [get_bd_pins FCLK_CLK0]
connect_bd_net [get_bd_pins processing_system7_0/FCLK_RESET0_N] [get_bd_pins FCLK_RESET0_N]
connect_bd_net [get_bd_pins rst_ps7_0_125M/interconnect_aresetn] [get_bd_pins axi_interconnect_0/ARESETN] [get_bd_pins axi_interconnect_1/ARESETN]
connect_bd_net [get_bd_pins rst_ps7_0_125M/peripheral_aresetn] \
  [get_bd_pins peripheral_aresetn] [get_bd_pins axi_cfg_register_cfg/aresetn] \
  [get_bd_pins axi_cfg_register_counter_trigger/aresetn] [get_bd_pins axi_cfg_register_dac/aresetn] \
  [get_bd_pins axi_interconnect_0/M00_ARESETN] [get_bd_pins axi_interconnect_0/M01_ARESETN] \
  [get_bd_pins axi_interconnect_0/M02_ARESETN] [get_bd_pins axi_interconnect_0/M03_ARESETN] \
  [get_bd_pins axi_interconnect_0/M04_ARESETN] [get_bd_pins axi_interconnect_0/M05_ARESETN] \
  [get_bd_pins axi_interconnect_0/M06_ARESETN] [get_bd_pins axi_interconnect_0/M07_ARESETN] \
  [get_bd_pins axi_interconnect_0/M08_ARESETN] [get_bd_pins axi_interconnect_0/M09_ARESETN] \
  [get_bd_pins axi_interconnect_0/S00_ARESETN] [get_bd_pins axi_interconnect_1/M00_ARESETN] \
  [get_bd_pins axi_interconnect_1/M01_ARESETN] [get_bd_pins axi_interconnect_1/M02_ARESETN] \
  [get_bd_pins axi_interconnect_1/S00_ARESETN] [get_bd_pins axi_sts_register_DIOIn/aresetn] \
  [get_bd_pins axi_sts_register_adc/aresetn] [get_bd_pins axi_sts_register_counter_trigger/aresetn] \
  [get_bd_pins axi_sts_register_image_version/aresetn] [get_bd_pins axi_sts_register_pdm/aresetn] \
  [get_bd_pins axi_sts_register_reset/aresetn]
connect_bd_net -net sts_data1_1 [get_bd_pins curr_pdm_values] [get_bd_pins axi_sts_register_pdm/sts_data]
connect_bd_net -net sts_data_1 [get_bd_pins reset_sts] [get_bd_pins axi_sts_register_reset/sts_data]
connect_bd_net [get_bd_pins sts_data] [get_bd_pins axi_sts_register_DIOIn/sts_data]
connect_bd_net -net trigger_counter_sts_1 [get_bd_pins counter_trigger_sts] [get_bd_pins axi_sts_register_counter_trigger/sts_data]
connect_bd_net -net xlconcat_0_dout [get_bd_pins adc_sts] [get_bd_pins axi_sts_register_adc/sts_data]
connect_bd_net [get_bd_pins xlconstant_6/dout] [get_bd_pins rst_ps7_0_125M/ext_reset_in]
set_property HDL_ATTRIBUTE.BMM_INFO_PROCESSOR {arm > system sequencer/axi_bram_ctrl_0 system fourier_synth_standard/signal_compose/waveform_awg/axi_bram_ctrl_0 system fourier_synth_standard/signal_compose1/waveform_awg1/axi_bram_ctrl_0} [get_bd_cells processing_system7_0]
set_property HDL_ATTRIBUTE.KEEP_HIERARCHY yes [get_bd_cells processing_system7_0]
